# Altium schematic sheet FPGA音乐演奏原理图.SchDoc
size C; SheetNumber: 0; SheetTotal: 0
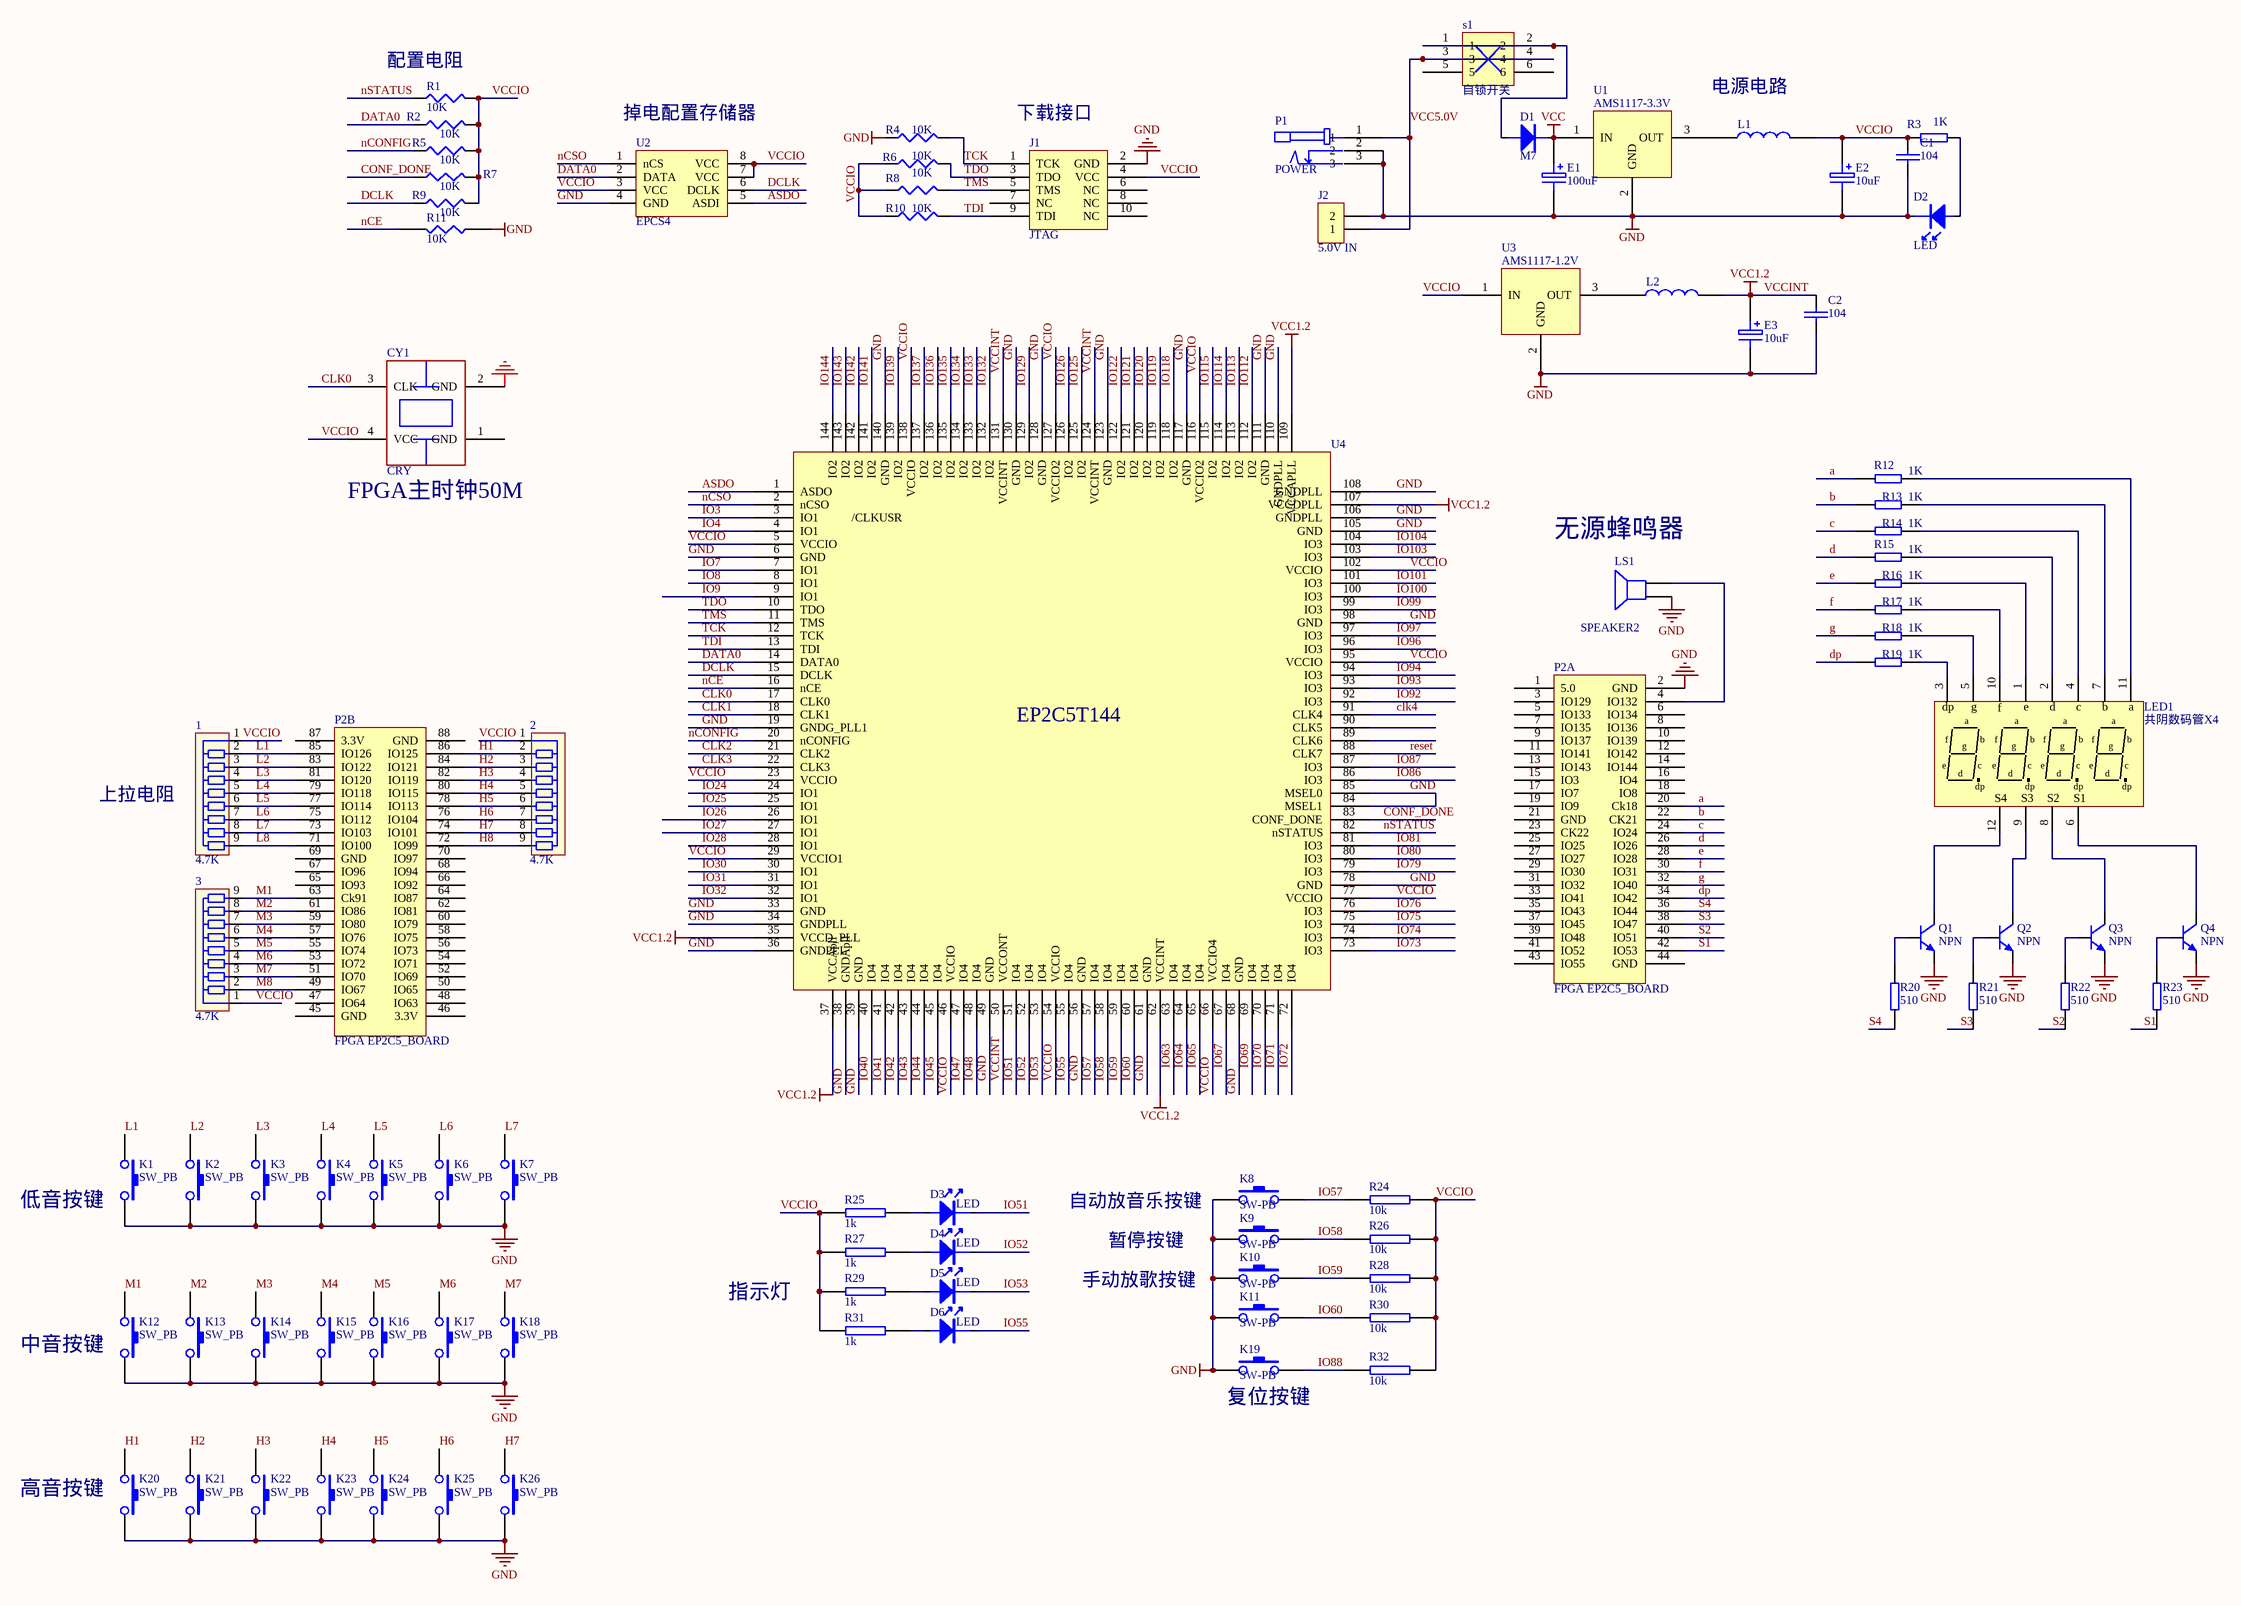
[diagram p0: FPGA音乐演奏原理图.SchDoc]

## Parts
1  4.7K  [排阻8位]
2  4.7K  [排阻8位]
3  4.7K  [排阻8位]
C1  104  [0805]
C2  104  [0805]
CY1  CRY  [XTAL6]
D1  M7  [D190]
D2  LED  [LED0805]
D3  LED  [LED0805]
D4  LED  [LED0805]
D5  LED  [LED0805]
D6  LED  [LED0805]
E1  100uF  [E300]
E2  10uF  [3528]
E3  10uF  [3528]
J1  JTAG  [IDC10]
J2  5.0V IN  [SIP2]
K1  SW_PB  [K1]
K2  SW_PB  [K1]
K3  SW_PB  [K1]
K4  SW_PB  [K1]
K5  SW_PB  [K1]
K6  SW_PB  [K1]
K7  SW_PB  [K1]
K8  SW-PB  [tkey]
K9  SW-PB  [tkey]
K10  SW-PB  [tkey]
K11  SW-PB  [tkey]
K12  SW_PB  [K1]
K13  SW_PB  [K1]
K14  SW_PB  [K1]
K15  SW_PB  [K1]
K16  SW_PB  [K1]
K17  SW_PB  [K1]
K18  SW_PB  [K1]
K19  SW-PB  [tkey]
K20  SW_PB  [K1]
K21  SW_PB  [K1]
K22  SW_PB  [K1]
K23  SW_PB  [K1]
K24  SW_PB  [K1]
K25  SW_PB  [K1]
K26  SW_PB  [K1]
L1  (no value)  [0805]
L2  (no value)  [0805]
LED1  共阴数码管X4  [数码管0.56/4]
LS1  SPEAKER2  [喇叭12X6.6]
P1  POWER  [POWER2.5]
P2  FPGA EP2C5_BOARD  [IDC88FPGA]  (parts A,B of 2)
Q1  NPN  [NPNSMD]
Q2  NPN  [NPNSMD]
Q3  NPN  [NPNSMD]
Q4  NPN  [NPNSMD]
R1  10K  [0805]
R2  10K  [0805]
R3  1K  [0805]
R4  10K  [0805]
R5  10K  [0805]
R6  10K  [0805]
R7  10K  [0805]
R8  10K  [0805]
R9  10K  [0805]
R10  10K  [0805]
R11  10K  [0805]
R12  1K  [0805R]
R13  1K  [0805R]
R14  1K  [0805R]
R15  1K  [0805R]
R16  1K  [0805R]
R17  1K  [0805R]
R18  1K  [0805R]
R19  1K  [0805R]
R20  510  [0805R]
R21  510  [0805R]
R22  510  [0805R]
R23  510  [0805R]
R24  10k  [0805]
R25  1k  [0805]
R26  10k  [0805]
R27  1k  [0805]
R28  10k  [0805]
R29  1k  [0805]
R30  10k  [0805]
R31  1k  [0805]
R32  10k  [0805]
s1  自锁开关  [zisuo6]
U1  AMS1117-3.3V  [ZV3.3V]
U2  EPCS4  [SOIC8]
U3  AMS1117-1.2V  [ZV3.3V]
U4  EP2C5T144  [TQFP144]

## Nets
GND: C1.2 C2.2 CY1.2(GND) D2.K E1.2 E2.2 E3.2 J1.2(GND) J2.2 K1.2 K2.2 K3.2 K4.2 K5.2 K6.2 K7.2 K8.1 K9.1 K10.1 K11.1 K12.2 K13.2 K14.2 K15.2 K16.2 K17.2 K18.2 K19.1 K20.2 K21.2 K22.2 K23.2 K24.2 K25.2 K26.2 LS1.1 P1.2 P1.3 P2.2(GND) Q1.2(E) Q2.2(E) Q3.2(E) Q4.2(E) R4.1 R11.1 U1.2(GND) U2.4(GND) U3.2(GND) U4.6(GND) U4.19(GNDG_PLL1) U4.33(GND) U4.34(GNDPLL) U4.36(GNDPLL) U4.38(GNDApll) U4.39(GND) U4.49(GND) U4.56(GND) U4.61(GND) U4.68(GND) U4.78(GND) U4.84(MSEL1) U4.85(MSEL0) U4.98(GND) U4.105(GND) U4.106(GNDPLL) U4.108(GNDPLL) U4.110(GNDPLL) U4.111(GND) U4.117(GND) U4.123(GND) U4.128(GND) U4.130(GND) U4.140(GND)
VCC: D1.K E1.1 U1.1(IN)
VCCINT: C2.1 E3.1 L2.2 U4.35(VCCD_PLL) U4.37(VCCApll) U4.50(VCCONT) U4.62(VCCINT) U4.107(VCCDPLL) U4.109(VCCAPLL) U4.124(VCCINT) U4.131(VCCINT)  [also labelled VCC1.2]
a: P2.20(Ck18) R12.1
ASDO: U2.5(ASDI) U4.1(ASDO)
b: P2.22(CK21) R13.1
c: P2.24(IO24) R14.1
CLK0: CY1.3(CLK) U4.17(CLK0)
CLK1: U4.18(CLK1)
CLK2: U4.21(CLK2)
CLK3: U4.22(CLK3)
clk4: U4.91(CLK4)
CONF_DONE: R7.1 U4.83(CONF_DONE)
d: P2.26(IO26) R15.1
DATA0: R2.1 U2.2(DATA) U4.14(DATA0)
DCLK: R9.1 U2.6(DCLK) U4.15(DCLK)
dp: P2.34(IO42) R19.1
e: P2.28(IO28) R16.1
f: P2.30(IO31) R17.1
g: P2.32(IO40) R18.1
H1: 2.2 K20.1 P2.86(IO125)
H2: 2.3 K21.1 P2.84(IO121)
H3: 2.4 K22.1 P2.82(IO119)
H4: 2.5 K23.1 P2.80(IO115)
H5: 2.6 K24.1 P2.78(IO113)
H6: 2.7 K25.1 P2.76(IO104)
H7: 2.8 K26.1 P2.74(IO101)
H8: 2.9 P2.72(IO99)
IO3: U4.3(IO1___________/CLKUSR)
IO4: U4.4(IO1)
IO7: U4.7(IO1)
IO8: U4.8(IO1)
IO9: U4.9(IO1)
IO24: U4.24(IO1)
IO25: U4.25(IO1)
IO26: U4.26(IO1)
IO27: U4.27(IO1)
IO28: U4.28(IO1)
IO30: U4.30(IO1)
IO31: U4.31(IO1)
IO32: U4.32(IO1)
IO40: U4.40(IO4)
IO41: U4.41(IO4)
IO42: U4.42(IO4)
IO43: U4.43(IO4)
IO44: U4.44(IO4)
IO45: U4.45(IO4)
IO47: U4.47(IO4)
IO48: U4.48(IO4)
IO51: D3.K U4.51(IO4)
IO52: D4.K U4.52(IO4)
IO53: D5.K U4.53(IO4)
IO55: D6.K U4.55(IO4)
IO57: K8.2 R24.1 U4.57(IO4)
IO58: K9.2 R26.1 U4.58(IO4)
IO59: K10.2 R28.1 U4.59(IO4)
IO60: K11.2 R30.1 U4.60(IO4)
IO63: U4.63(IO4)
IO64: U4.64(IO4)
IO65: U4.65(IO4)
IO67: U4.67(IO4)
IO69: U4.69(IO4)
IO70: U4.70(IO4)
IO71: U4.71(IO4)
IO72: U4.72(IO4)
IO73: U4.73(IO3)
IO74: U4.74(IO3)
IO75: U4.75(IO3)
IO76: U4.76(IO3)
IO79: U4.79(IO3)
IO80: U4.80(IO3)
IO81: U4.81(IO3)
IO86: U4.86(IO3)
IO87: U4.87(IO3)
IO88: K19.2 R32.1
IO92: U4.92(IO3)
IO93: U4.93(IO3)
IO94: U4.94(IO3)
IO96: U4.96(IO3)
IO97: U4.97(IO3)
IO99: U4.99(IO3)
IO100: U4.100(IO3)
IO101: U4.101(IO3)
IO103: U4.103(IO3)
IO104: U4.104(IO3)
IO112: U4.112(IO2)
IO113: U4.113(IO2)
IO114: U4.114(IO2)
IO115: U4.115(IO2)
IO118: U4.118(IO2)
IO119: U4.119(IO2)
IO120: U4.120(IO2)
IO121: U4.121(IO2)
IO122: U4.122(IO2)
IO125: U4.125(IO2)
IO126: U4.126(IO2)
IO129: U4.129(IO2)
IO132: U4.132(IO2)
IO133: U4.133(IO2)
IO134: U4.134(IO2)
IO135: U4.135(IO2)
IO136: U4.136(IO2)
IO137: U4.137(IO2)
IO139: U4.139(IO2)
IO141: U4.141(IO2)
IO142: U4.142(IO2)
IO143: U4.143(IO2)
IO144: U4.144(IO2)
L1: 1.2 K1.1 P2.85(IO126)
L2: 1.3 K2.1 P2.83(IO122)
L3: 1.4 K3.1 P2.81(IO120)
L4: 1.5 K4.1 P2.79(IO118)
L5: 1.6 K5.1 P2.77(IO114)
L6: 1.7 K6.1 P2.75(IO112)
L7: 1.8 K7.1 P2.73(IO103)
L8: 1.9 P2.71(IO100)
M1: 3.9 K12.1 P2.63(Ck91)
M2: 3.8 K13.1 P2.61(IO86)
M3: 3.7 K14.1 P2.59(IO80)
M4: 3.6 K15.1 P2.57(IO76)
M5: 3.5 K16.1 P2.55(IO74)
M6: 3.4 K17.1 P2.53(IO72)
M7: 3.3 K18.1 P2.51(IO70)
M8: 3.2 P2.49(IO67)
nCE: R11.2 U4.16(nCE)
nCONFIG: R5.1 U4.20(nCONFIG)
nCSO: U2.1(nCS) U4.2(nCSO)
nSTATUS: R1.1 U4.82(nSTATUS)
reset: U4.88(CLK7)
S1: P2.42(IO53) R23.1
S2: P2.40(IO51) R22.1
S3: P2.38(IO47) R21.1
S4: P2.36(IO44) R20.1
TCK: J1.1(TCK) R4.2 U4.12(TCK)
TDI: J1.9(TDI) R10.2 U4.13(TDI)
TDO: J1.3(TDO) R6.2 U4.10(TDO)
TMS: J1.5(TMS) R8.2 U4.11(TMS)
VCC5.0V: J2.1 P1.1 s1.3 s1.4
VCCIO: 1.1 2.1 3.1 C1.1 CY1.4(VCC) E2.1 J1.4(VCC) L1.2 R1.2 R2.2 R3.1 R5.2 R6.1 R7.2 R8.1 R9.2 R10.1 R24.2 R25.1 R26.2 R27.1 R28.2 R29.1 R30.2 R31.1 R32.2 U2.3(VCC) U2.7(VCC) U2.8(VCC) U3.1(IN) U4.5(VCCIO) U4.23(VCCIO) U4.29(VCCIO1) U4.46(VCCIO) U4.54(VCCIO) U4.66(VCCIO4) U4.77(VCCIO) U4.95(VCCIO) U4.102(VCCIO) U4.116(VCCIO2) U4.127(VCCIO2) U4.138(VCCIO)
NetD1_A: D1.A s1.1 s1.2
NetD2_A: D2.A R3.2
NetD3_A: D3.A R25.2
NetD4_A: D4.A R27.2
NetD5_A: D5.A R29.2
NetD6_A: D6.A R31.2
NetL1_1: L1.1 U1.3(OUT)
NetL2_1: L2.1 U3.3(OUT)
NetLED1_1: LED1.1(E) R16.2
NetLED1_2: LED1.2(D) R15.2
NetLED1_3: LED1.3(dp) R19.2
NetLED1_4: LED1.4(C) R14.2
NetLED1_5: LED1.5(G) R18.2
NetLED1_6: LED1.6(S1) Q4.3(C)
NetLED1_7: LED1.7(B) R13.2
NetLED1_8: LED1.8(S2) Q3.3(C)
NetLED1_9: LED1.9(S3) Q2.3(C)
NetLED1_10: LED1.10(F) R17.2
NetLED1_11: LED1.11(A) R12.2
NetLED1_12: LED1.12(S4) Q1.3(C)
NetLS1_2: LS1.2 P2.4(IO132)
NetQ1_1: Q1.1(B) R20.2
NetQ2_1: Q2.1(B) R21.2
NetQ3_1: Q3.1(B) R22.2
NetQ4_1: Q4.1(B) R23.2

Not connected (* = marked no-connect by the designer): CY1 1(GND); J1 6(NC) 7(NC) 8(NC) 10(NC); P2 1(5.0) 3(IO129) 5(IO133) 6(IO134) 7(IO135) 8(IO136) 9(IO137) 10(IO139) 11(IO141) 12(IO142) 13(IO143) 14(IO144) 15(IO3) 16(IO4) 17(IO7) 18(IO8) 19(IO9) 21(GND) 23(CK22) 25(IO25) 27(IO27) 29(IO30) 31(IO32) 33(IO41) 35(IO43) 37(IO45) 39(IO48) 41(IO52) 43(IO55) 44(GND) 45(GND) 46(3.3V) 47(IO64) 48(IO63) 50(IO65) 52(IO69) 54(IO71) 56(IO73) 58(IO75) 60(IO79) 62(IO81) 64(IO87) 65(IO93) 66(IO92) 67(IO96) 68(IO94) 69(GND) 70(IO97) 87(3.3V) 88(GND); s1 5 6; U4 89(CLK6) 90(CLK5)

## Notes on the sheet
- (near R1) 配置电阻
- 电源电路
- (near U2) 掉电配置存储器
- (near J1) 下载接口
- (near CY1) FPGA主时钟50M
- (near LS1) 无源蜂鸣器
- 上拉电阻
- 低音按键
- 自动放音乐按键
- 手动放歌按键
- 暂停按键
- 中音按键
- 指示灯
- (near K19) 复位按键
- 高音按键
- (in symbol 数码管X4) g; f; e; d; c; b; a

## Library data of the parts
1-3 = RES8
C1 C2 = CAP: Capacitor
D1 = DIODE
E1-E3 = ELECTRO1: Electrolytic Capacitor
J2 = CON2: Connector
K1-K7 K12-K18 K20-K26 = SW_PB: 微动开关
L1 L2 = INDUCTOR1
LED1 = 数码管X4
LS1 = SPEAKER2: 喇叭
P2 = EP2C5_BOARD: FPGA; LatestRevisionDate: 17-Jul-2002; LatestRevisionNote: Re-released for DXP Platform.; Publisher: Altium Limited
Q1-Q4 = NPN: NPN Bipolar Transistor; Published: 8-Jun-2000; LatestRevisionDate: 17-Jul-2002; LatestRevisionNote: Re-released for DXP Platform.; PackageReference: TO-226; Publisher: Altium Limited; Code_JEDEC: TO-226-AA
R1 R2 R4-R11 = RES1
R3 R24-R32 = RES2
R12-R23 = Res2: 电阻
U1 U3 = 78XX